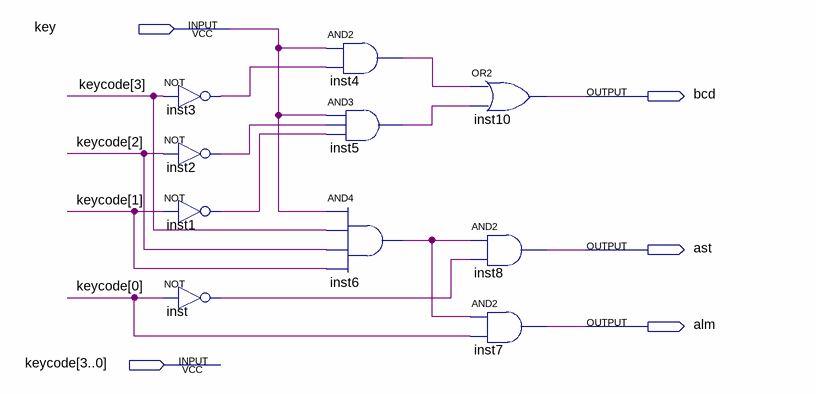
[diagram p0: schematic sheet]
// Quartus schematic keygroup.bdf as structural Verilog: 10 symbols, 5 pins
module keygroup (
  input  key,
  input  [3:0] keycode,
  output bcd,
  output ast,
  output alm
);

  wire inst1_out, inst2_out, inst3_out, inst4_out, inst5_out, inst6_out, inst_out;

  not inst3 (inst3_out, keycode[3]);
  not inst2 (inst2_out, keycode[2]);
  not inst1 (inst1_out, keycode[1]);
  not inst (inst_out, keycode[0]);
  and inst4 (inst4_out, key, inst3_out);
  and inst5 (inst5_out, key, inst2_out, inst1_out);
  and inst6 (inst6_out, key, keycode[3], keycode[2], keycode[1]);
  or inst10 (bcd, inst4_out, inst5_out);
  and inst8 (ast, inst6_out, inst_out);
  and inst7 (alm, inst6_out, keycode[0]);
endmodule
